# Altium schematic sheet Power Tree.SchDoc: Power Tree
size A4; DocumentNumber: 2; SheetNumber: 2; SheetTotal: 10
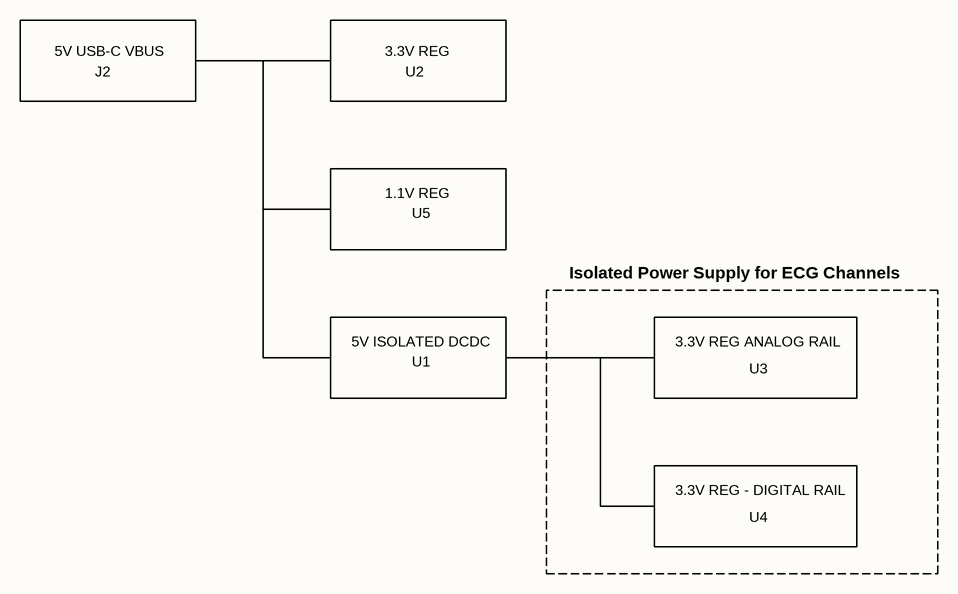
[diagram p0: Power Tree.SchDoc]

## Notes on the sheet
- 5V USB-C VBUS
- 3.3V REG
- J2
- U2
- 1.1V REG
- U5
- Isolated Power Supply for ECG Channels
- 5V ISOLATED DCDC
- U1
- 3.3V REG ANALOG RAIL
- U3
- 3.3V REG - DIGITAL RAIL
- U4
- COMMERCIAL IN CONFIDENCE
- CLIENT
- THIS DOCUMENT IS UNCONTROLLED WHEN PRINTED
- PROJECT
- PART NAME
- TITLE
- SHEET SIZE
- SHEET
- DATE
- A4
- FILE
- PROJECT CODE
- PART / DWG No.
- REV
- VARIANT
- AUTHOR